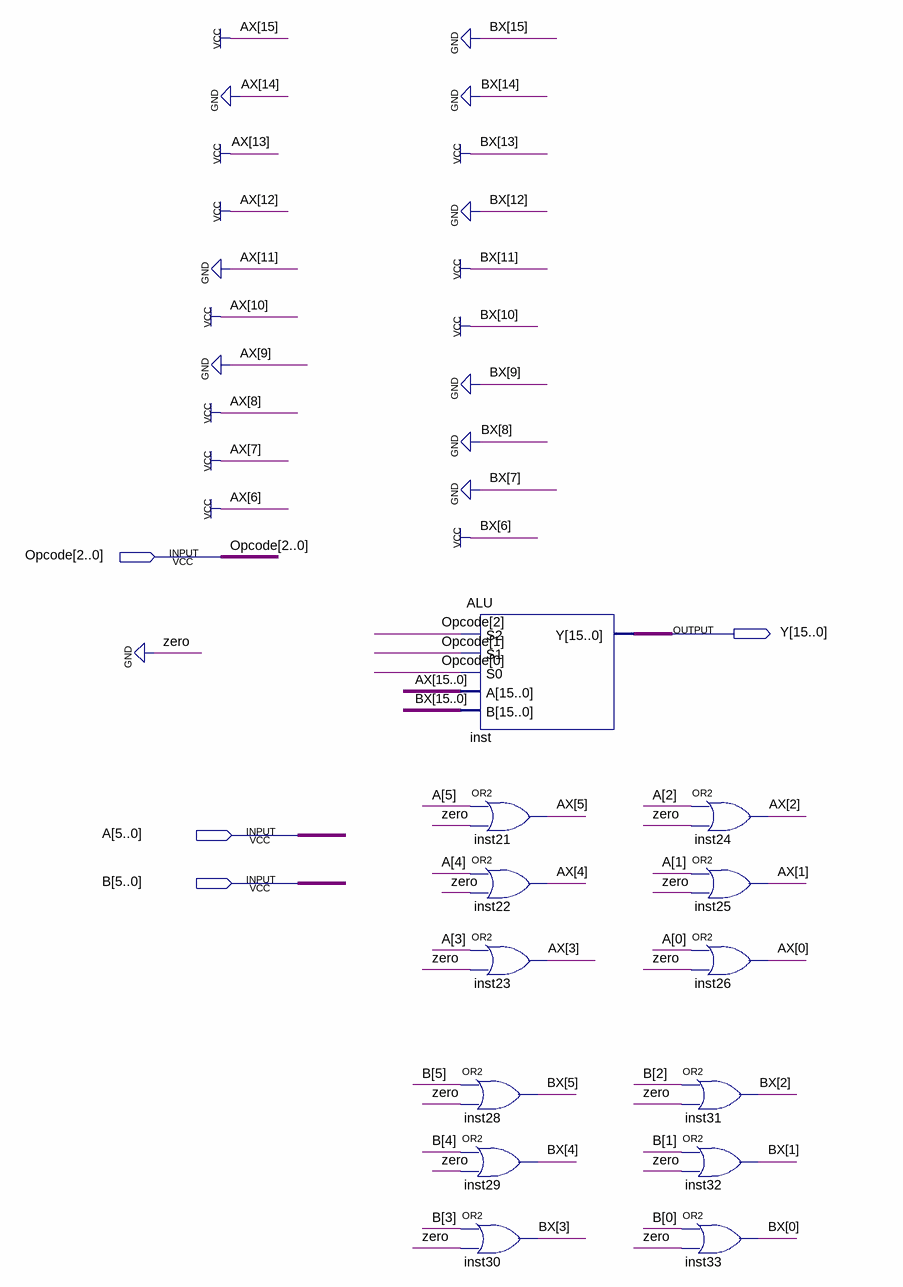
[diagram p0: schematic sheet]
// Quartus schematic mach_cuoi_duy_nhat.bdf as structural Verilog: 13 symbols, 4 pins
module mach_cuoi_duy_nhat (
  input  [2:0] Opcode,
  input  [5:0] A,
  input  [5:0] B,
  output [15:0] Y
);

  wire [5:0] AX, BX;

  ALU inst (.S2(Opcode[2]), .S1(Opcode[1]), .S0(Opcode[0]), .A({10'b1011010111, AX}), .B({10'b0010110001, BX}), .Y(Y));
  or inst21 (AX[5], A[5], 1'b0);
  or inst22 (AX[4], A[4], 1'b0);
  or inst23 (AX[3], A[3], 1'b0);
  or inst28 (BX[5], B[5], 1'b0);
  or inst29 (BX[4], B[4], 1'b0);
  or inst30 (BX[3], B[3], 1'b0);
  or inst24 (AX[2], A[2], 1'b0);
  or inst25 (AX[1], A[1], 1'b0);
  or inst26 (AX[0], A[0], 1'b0);
  or inst31 (BX[2], B[2], 1'b0);
  or inst32 (BX[1], B[1], 1'b0);
  or inst33 (BX[0], B[0], 1'b0);
endmodule
